# Altium schematic sheet Nguon.SchDoc
size 381 x 241 mm; SheetNumber: 2; SheetTotal: 4
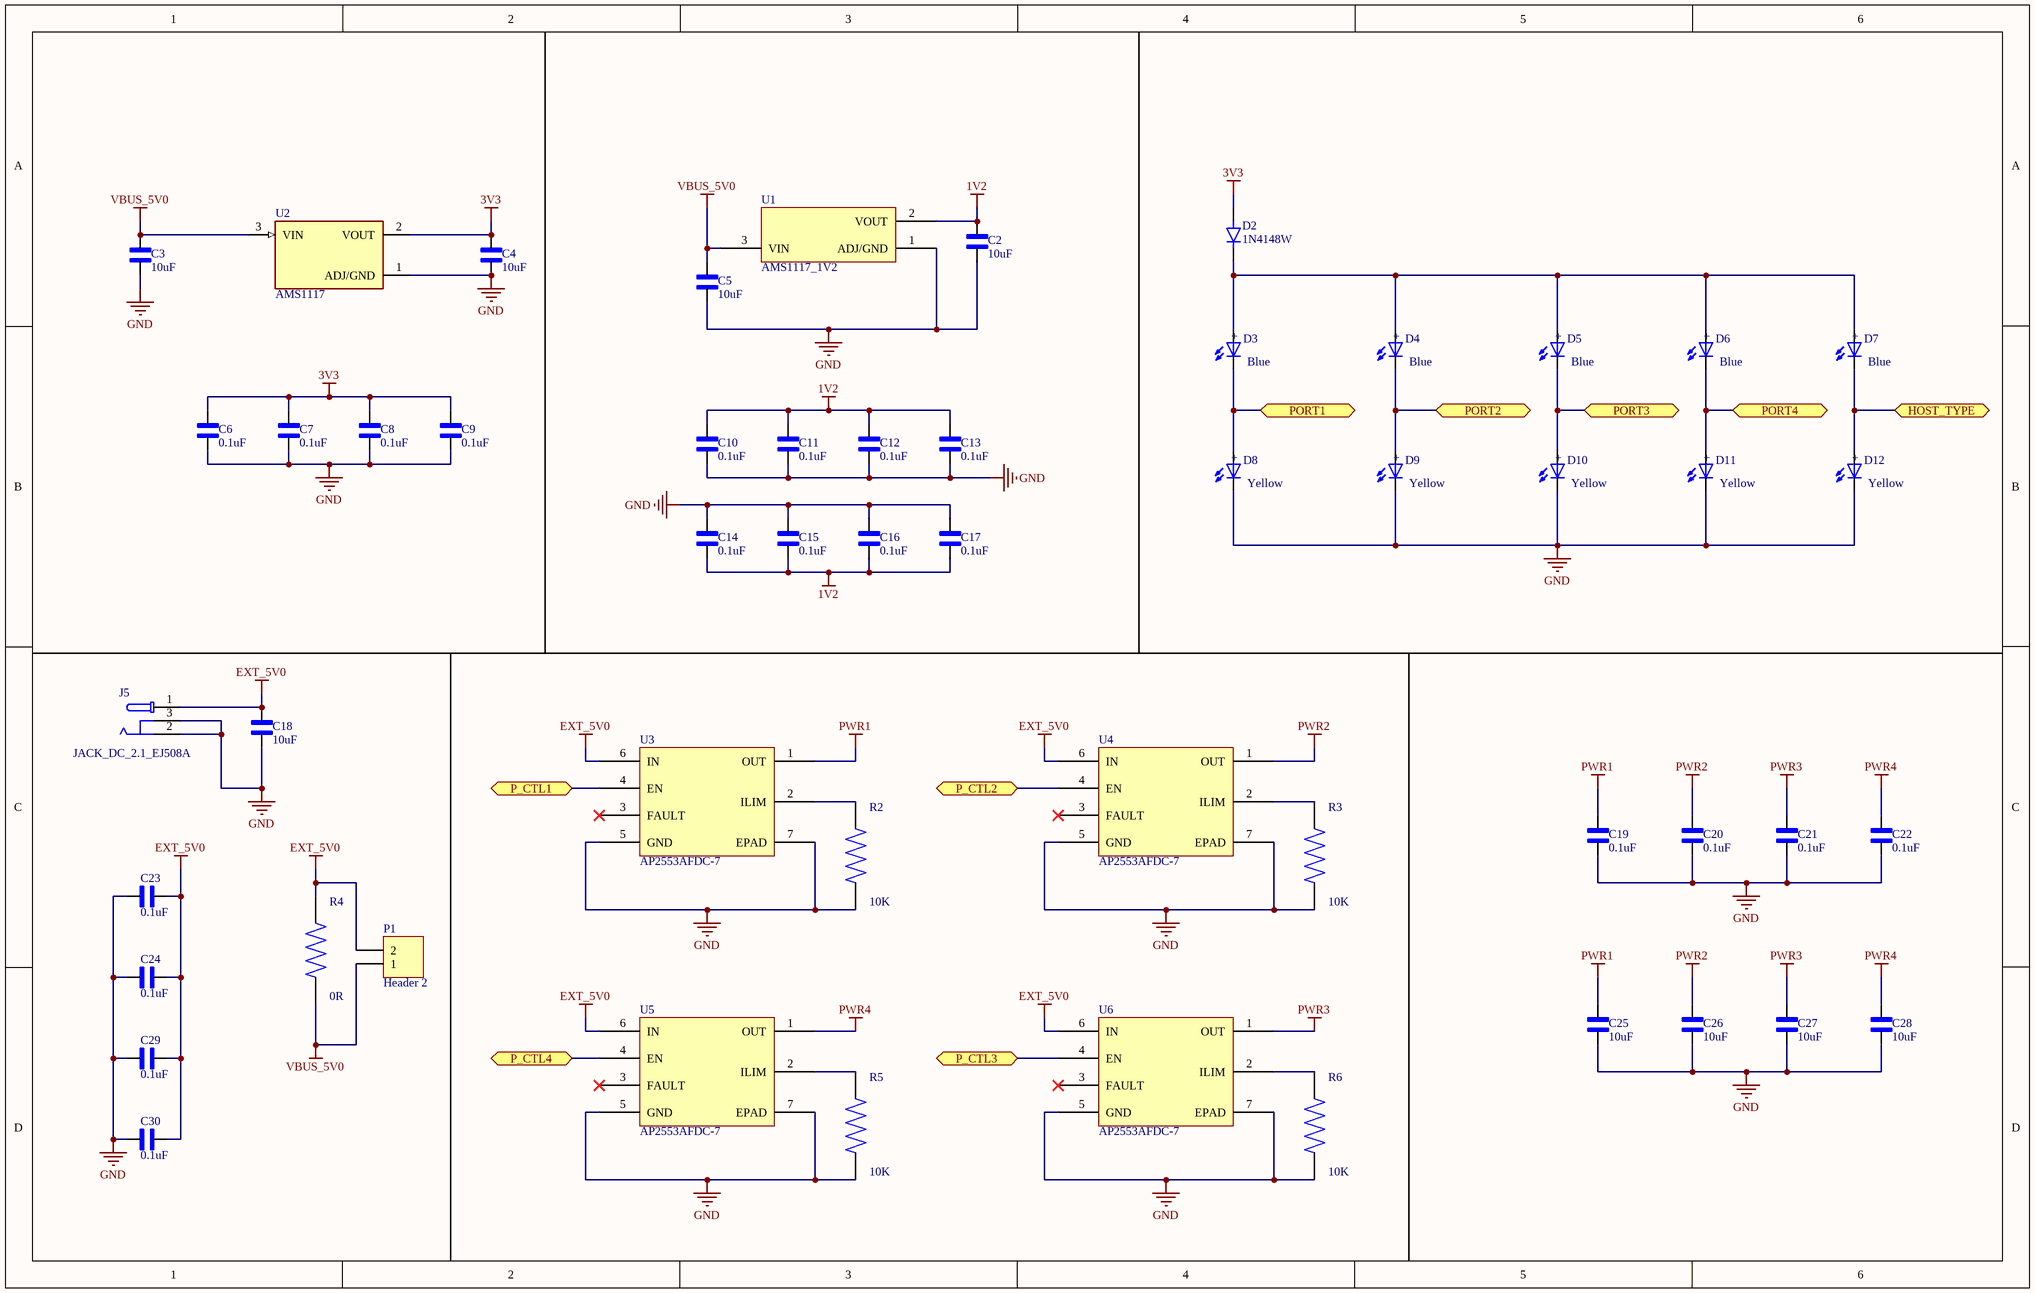
[diagram p0: Nguon.SchDoc]

## Parts
C2  10uF  [CAPC3216X170N]
C3  10uF  [CAPC3216X170N]
C4  10uF  [CAPC3216X170N]
C5  10uF  [CAPC3216X170N]
C6  0.1uF  [CAPC1608X94N]
C7  0.1uF  [CAPC1608X94N]
C8  0.1uF  [CAPC1608X94N]
C9  0.1uF  [CAPC1608X94N]
C10  0.1uF  [CAPC1608X94N]
C11  0.1uF  [CAPC1608X94N]
C12  0.1uF  [CAPC1608X94N]
C13  0.1uF  [CAPC1608X94N]
C14  0.1uF  [CAPC1608X94N]
C15  0.1uF  [CAPC1608X94N]
C16  0.1uF  [CAPC1608X94N]
C17  0.1uF  [CAPC1608X94N]
C18  10uF  [CAPC3216X170N]
C19  0.1uF  [CAPC1608X94N]
C20  0.1uF  [CAPC1608X94N]
C21  0.1uF  [CAPC1608X94N]
C22  0.1uF  [CAPC1608X94N]
C23  0.1uF  [CAPC1608X94N]
C24  0.1uF  [CAPC1608X94N]
C25  10uF  [CAPC3216X170N]
C26  10uF  [CAPC3216X170N]
C27  10uF  [CAPC3216X170N]
C28  10uF  [CAPC3216X170N]
C29  0.1uF  [CAPC1608X94N]
C30  0.1uF  [CAPC1608X94N]
D2  1N4148W  [SODFL3816X120N]
D3  Blue  [WL-SMCW_1206]
D4  Blue  [WL-SMCW_1206]
D5  Blue  [WL-SMCW_1206]
D6  Blue  [WL-SMCW_1206]
D7  Blue  [WL-SMCW_1206]
D8  Yellow  [WL-SMCW_1206]
D9  Yellow  [WL-SMCW_1206]
D10  Yellow  [WL-SMCW_1206]
D11  Yellow  [WL-SMCW_1206]
D12  Yellow  [WL-SMCW_1206]
J5  JACK_DC_2.1_EJ508A  [MPD_EJ508A]
P1  Header 2  [HDR1X2]
R2  10K  [RES_ERJU03J474V]
R3  10K  [RES_ERJU03J474V]
R4  0R  [RES_ERJU03J474V]
R5  10K  [RES_ERJU03J474V]
R6  10K  [RES_ERJU03J474V]
U1  AMS1117_1V2  [AMS1117_1V2]
U2  AMS1117  [SOT229P700X180-4N]
U3  AP2553AFDC-7  [AP2553AFDC-7]
U4  AP2553AFDC-7  [AP2553AFDC-7]
U5  AP2553AFDC-7  [AP2553AFDC-7]
U6  AP2553AFDC-7  [AP2553AFDC-7]

## Ports
HOST_TYPE (bidir), P_CTL1 (bidir), P_CTL2 (bidir), P_CTL3 (bidir), P_CTL4 (bidir), PORT1 (bidir), PORT2 (bidir), PORT3 (bidir), PORT4 (bidir)

## Nets
1V2: C2.2 C10.2 C11.2 C12.2 C13.2 C14.1 C15.1 C16.1 C17.1 U1.2(VOUT)
3V3: C4.2 C6.2 C7.2 C8.2 C9.2 D2.A U2.2(VOUT)
EXT_5V0: C18.2 C23.2 C24.2 C29.2 C30.2 J5.1 P1.2 R4.2 U3.6(IN) U4.6(IN) U5.6(IN) U6.6(IN)
GND: C2.1 C3.1 C4.1 C5.1 C6.1 C7.1 C8.1 C9.1 C10.1 C11.1 C12.1 C13.1 C14.2 C15.2 C16.2 C17.2 C18.1 C19.1 C20.1 C21.1 C22.1 C23.1 C24.1 C25.1 C26.1 C27.1 C28.1 C29.1 C30.1 D8.1(NEG) D9.1(NEG) D10.1(NEG) D11.1(NEG) D12.1(NEG) J5.2 J5.3 R2.1 R3.1 R5.1 R6.1 U1.1(ADJ/GND) U2.1(ADJ/GND) U3.5(GND) U3.7(EPAD) U4.5(GND) U4.7(EPAD) U5.5(GND) U5.7(EPAD) U6.5(GND) U6.7(EPAD)
PWR1: C19.2 C25.2 U3.1(OUT)
PWR2: C20.2 C26.2 U4.1(OUT)
PWR3: C21.2 C27.2 U6.1(OUT)
PWR4: C22.2 C28.2 U5.1(OUT)
VBUS_5V0: C3.2 C5.2 P1.1 R4.1 U1.3(VIN) U2.3(VIN)
HOST_TYPE: D7.1(NEG) D12.2(POS) ; port HOST_TYPE
P_CTL1: U3.4(EN) ; port P_CTL1
P_CTL2: U4.4(EN) ; port P_CTL2
P_CTL3: U6.4(EN) ; port P_CTL3
P_CTL4: U5.4(EN) ; port P_CTL4
PORT1: D3.1(NEG) D8.2(POS) ; port PORT1
PORT2: D4.1(NEG) D9.2(POS) ; port PORT2
PORT3: D5.1(NEG) D10.2(POS) ; port PORT3
PORT4: D6.1(NEG) D11.2(POS) ; port PORT4
NetD2_C: D2.C(K) D3.2(POS) D4.2(POS) D5.2(POS) D6.2(POS) D7.2(POS)
NetR2_2: R2.2 U3.2(ILIM)
NetR3_2: R3.2 U4.2(ILIM)
NetR5_2: R5.2 U5.2(ILIM)
NetR6_2: R6.2 U6.2(ILIM)

Not connected (* = marked no-connect by the designer): U3 3(FAULT)*; U4 3(FAULT)*; U5 3(FAULT)*; U6 3(FAULT)*

## Notes on the sheet
- (in symbol WL-SMCW_1206) +

## Library data of the parts
C2-C5 C18 C25-C28 = cap_1206_VJ1206A330JXCAP: cap 1206 (3216 Metric); MF: Vishay Vitramon; SnapEDA_Link: https://www.snapeda.com/parts/VJ1206A330JXCAP/Vishay/view-part/?ref=snap; Package: 3216 Vishay Vitramon; Value: *; MP: VJ1206A330JXCAP; Check_prices: https://www.snapeda.com/parts/VJ1206A330JXCAP/Vishay/view-part/?ref=eda
C6-C17 C19-C24 C29 C30 = cap_0603_VJ0603D3R9DXCAP: cap 0603 (1608 Metric); MF: Vishay Vitramon; SnapEDA_Link: https://www.snapeda.com/parts/VJ0603D3R9DXCAP/Vishay/view-part/?ref=snap; Package: 1608 Vishay Vitramon; Value: *; MP: VJ0603D3R9DXCAP; Check_prices: https://www.snapeda.com/parts/VJ0603D3R9DXCAP/Vishay/view-part/?ref=eda
D2 = 1N4148W: Small Signal Diode, SOD-123F, 100V, 0.15A, 150Â°C; MF: Diotec Semiconductor; SnapEDA_Link: https://www.snapeda.com/parts/1N4148W/Diotec/view-part/?ref=snap; Package: SOD-123F Diotec; Value: *; MP: 1N4148W; Check_prices: https://www.snapeda.com/parts/1N4148W/Diotec/view-part/?ref=eda
D3-D7 = WL-SMCW_1206: 1206, Blue Typ.(@20mA): 470nm, 145mcd, 3.2V, 140Â° InGaN; MF: Wurth Electronics; MP: 150120BS75000; SnapEDA_Link: https://www.snapeda.com/parts/150120BS75000/Wurth+Electronics/view-part/?ref=snap; Package: 1206 Wurth Electronics; Value: *; Check_prices: https://www.snapeda.com/parts/150120BS75000/Wurth+Electronics/view-part/?ref=eda
D8-D12 = WL-SMCW_1206: 1206,  Yellow Typ.(@20mA): 470nm, 145mcd, 3.2V, 140Â° InGaN; MF: Wurth Electronics; MP: 150120BS75000; SnapEDA_Link: https://www.snapeda.com/parts/150120BS75000/Wurth+Electronics/view-part/?ref=snap; Package: 1206 Wurth Electronics; Value: *; Check_prices: https://www.snapeda.com/parts/150120BS75000/Wurth+Electronics/view-part/?ref=eda
J5 = JACK_DC_2.1_EJ508A: Power Barrel Connector Jack 2.10mm ID _0.083_, 5.50mm OD _0.217_ Through Hole, Right Angle / EJ508A; MF: MPD; Package: Non-Standard MPD; Value: *; SnapEDA_Link: https://www.snapeda.com/parts/EJ508A/MPD%20%28Memory%20Protection%20Devices%29/view-part/474399/?ref=snap; Price: None; MP: EJ508A; Availability: Unavailable
P1 = Header 2: Header, 2-Pin; LatestRevisionDate: 17-Jul-2002; LatestRevisionNote: Re-released for DXP Platform.; Publisher: Altium Limited
R2-R6 = res_0603_ERJU03J474V: 0603 Anti-Sulfurated; MF: Panasonic; SnapEDA_Link: https://www.snapeda.com/parts/ERJU03J474V/Panasonic/view-part/?ref=snap; Package: 1608-2 Panasonic; Value: *; MP: ERJU03J474V; Check_prices: https://www.snapeda.com/parts/ERJU03J474V/Panasonic/view-part/?ref=eda
U2 = AMS1117: 1A LOW DROPOUT VOLTAGE REGULATOR SOT-223; MF: Advanced Monolithic Systems; SnapEDA_Link: https://www.snapeda.com/parts/AMS1117/Advanced+Monolithic+Systems/view-part/?ref=snap; Package: SOT-223 Seeed Technology; Value: *; MP: AMS1117; Check_prices: https://www.snapeda.com/parts/AMS1117/Advanced+Monolithic+Systems/view-part/?ref=eda